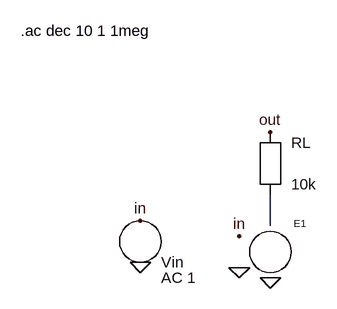
[diagram p0: schematic vcvs_stage_labelled.asc]
vcvs_stage_labelled.asc, the LTspice schematic file:
Version 4
SHEET 1 880 680
WIRE 400 316 400 268
FLAG 400 172 out
FLAG 400 396 0
FLAG 352 332 in
FLAG 352 380 0
FLAG 200 308 in
FLAG 200 372 0
SYMBOL e 400 300 R0
SYMATTR InstName E1
SYMATTR Value 2
SYMBOL res 400 220 R0
SYMATTR InstName RL
SYMATTR Value 10k
SYMBOL voltage 200 340 R0
SYMATTR InstName Vin
SYMATTR Value AC 1
TEXT 16 16 Left 2 !.ac dec 10 1 1meg

The netlist it stands for:
* vcvs_stage_labelled.asc
E1 N001 0 in 0 2
RL out N001 10k
Vin in 0 AC 1
.ac dec 10 1 1meg
.backanno
.end